# EasyEDA Pro project satelitesbol.eprj, board PCB7
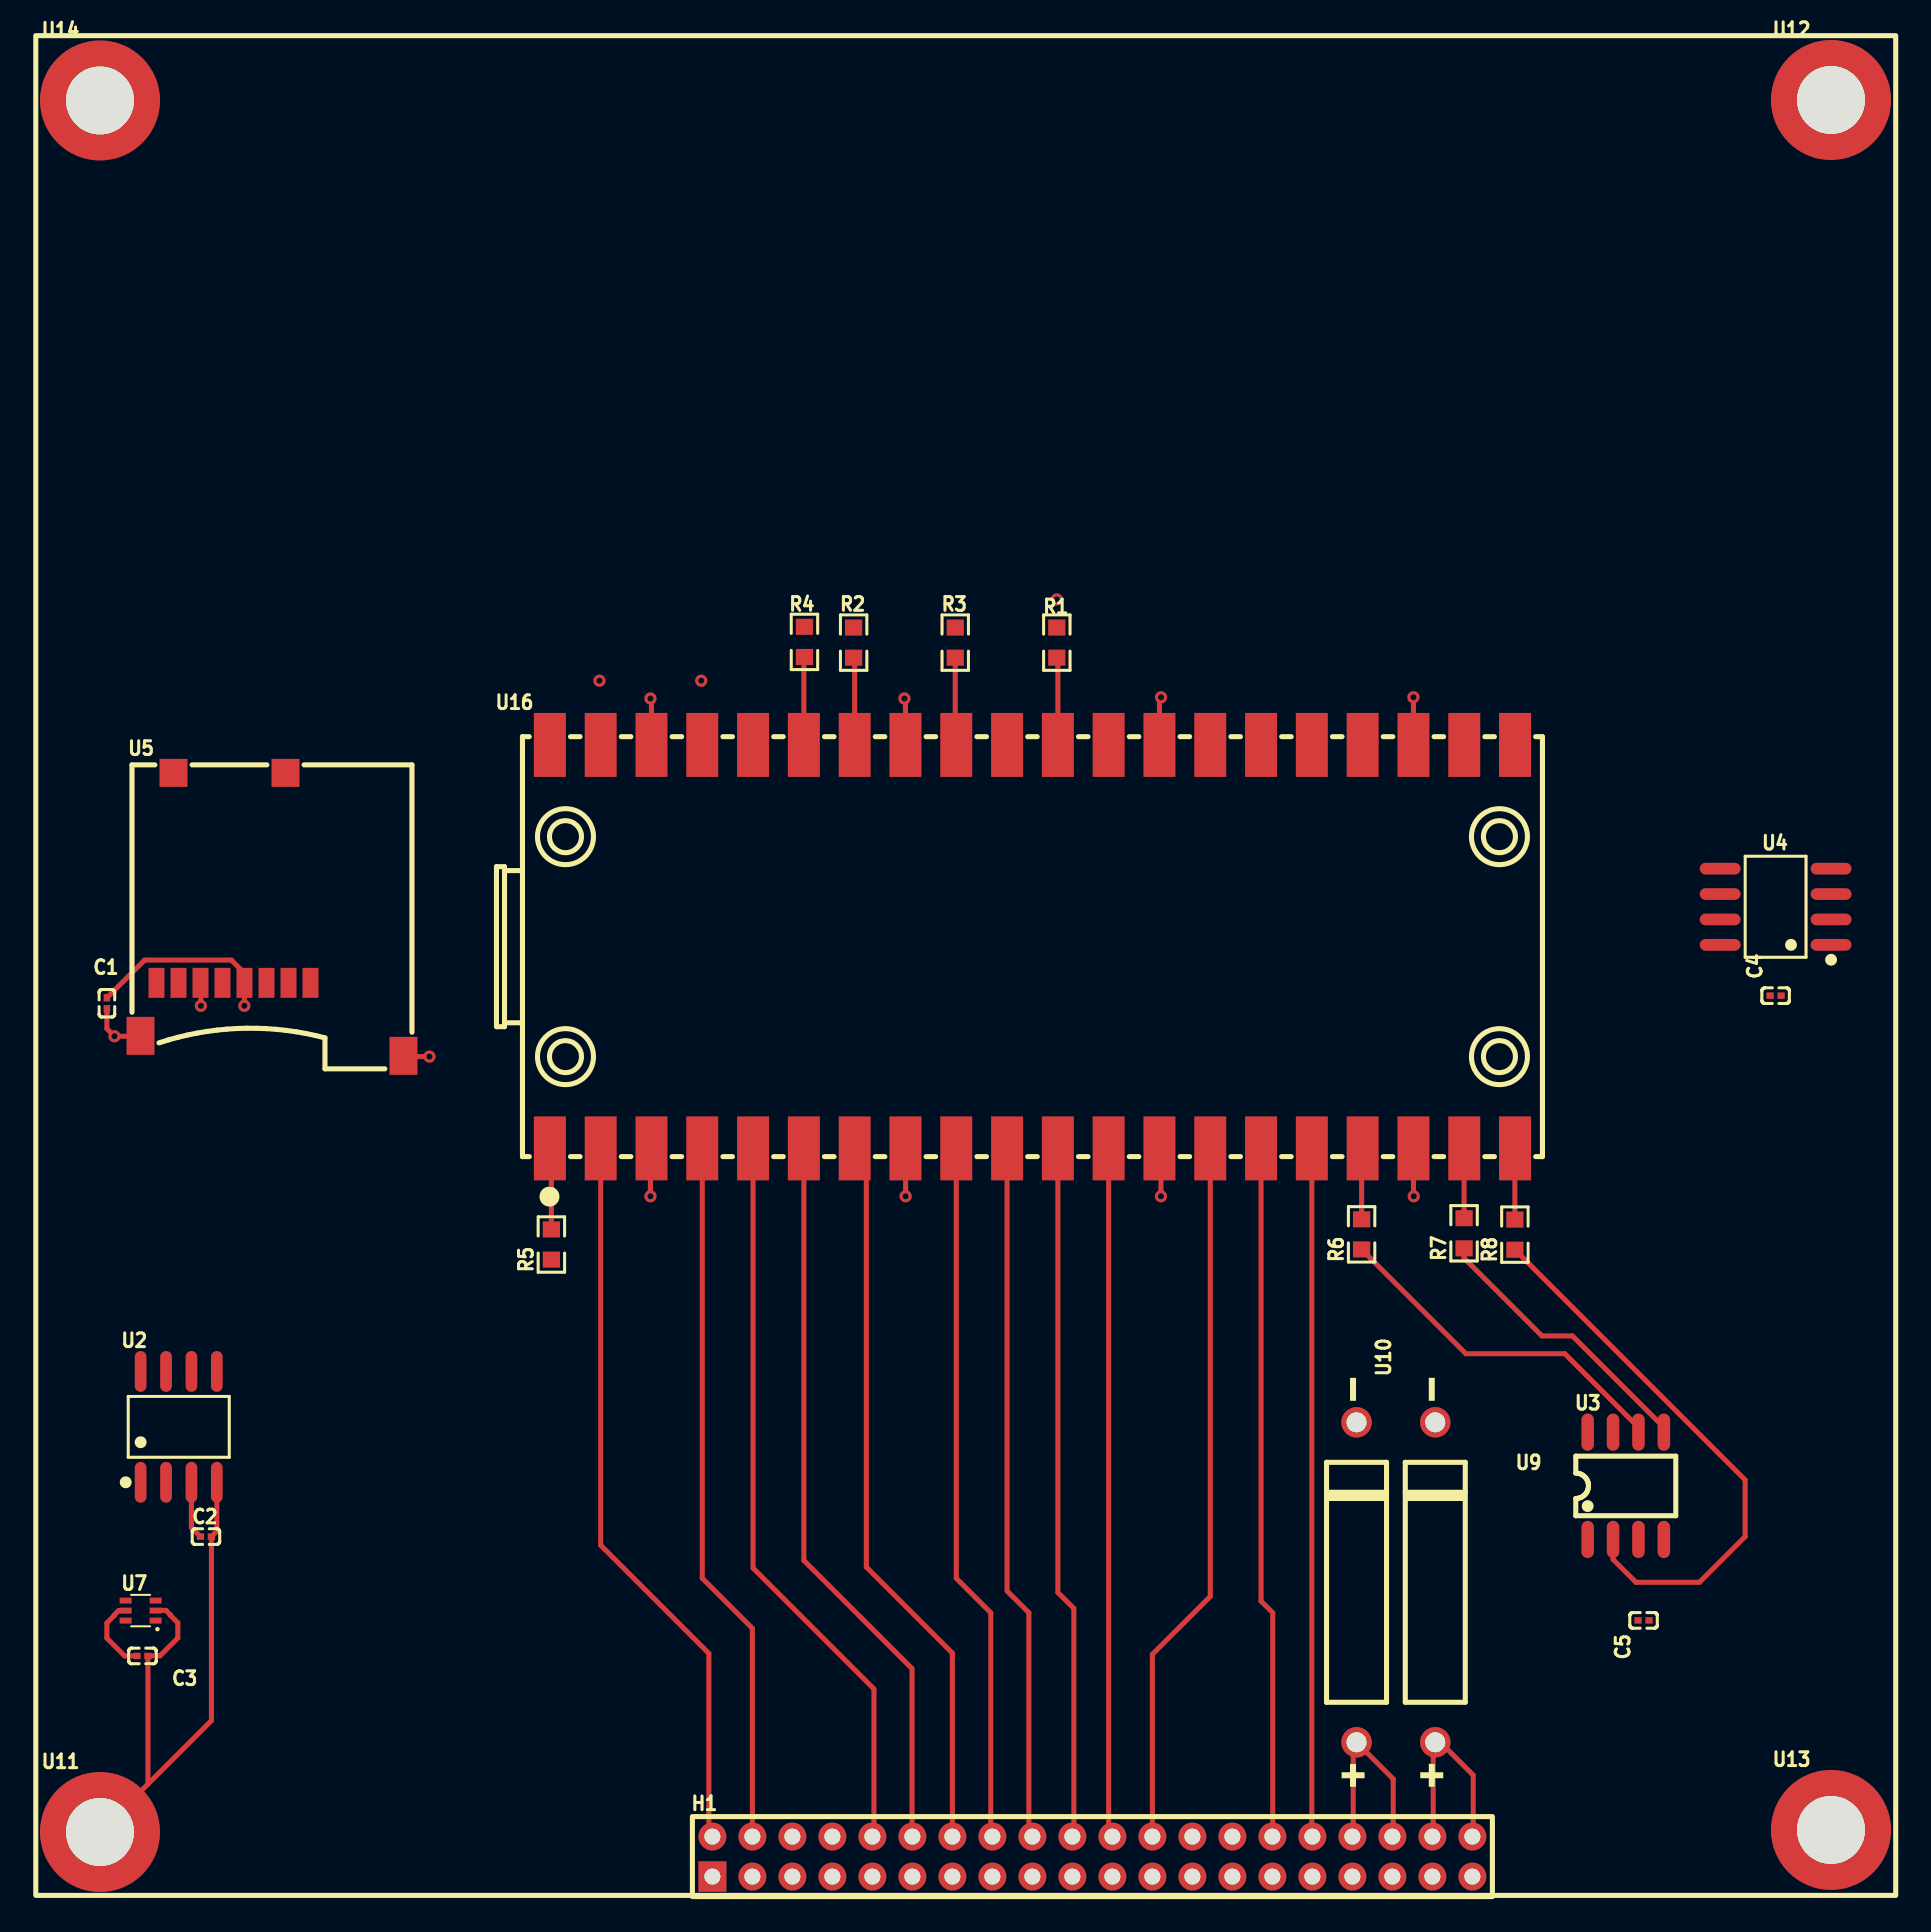
[diagram p8: board, top side]
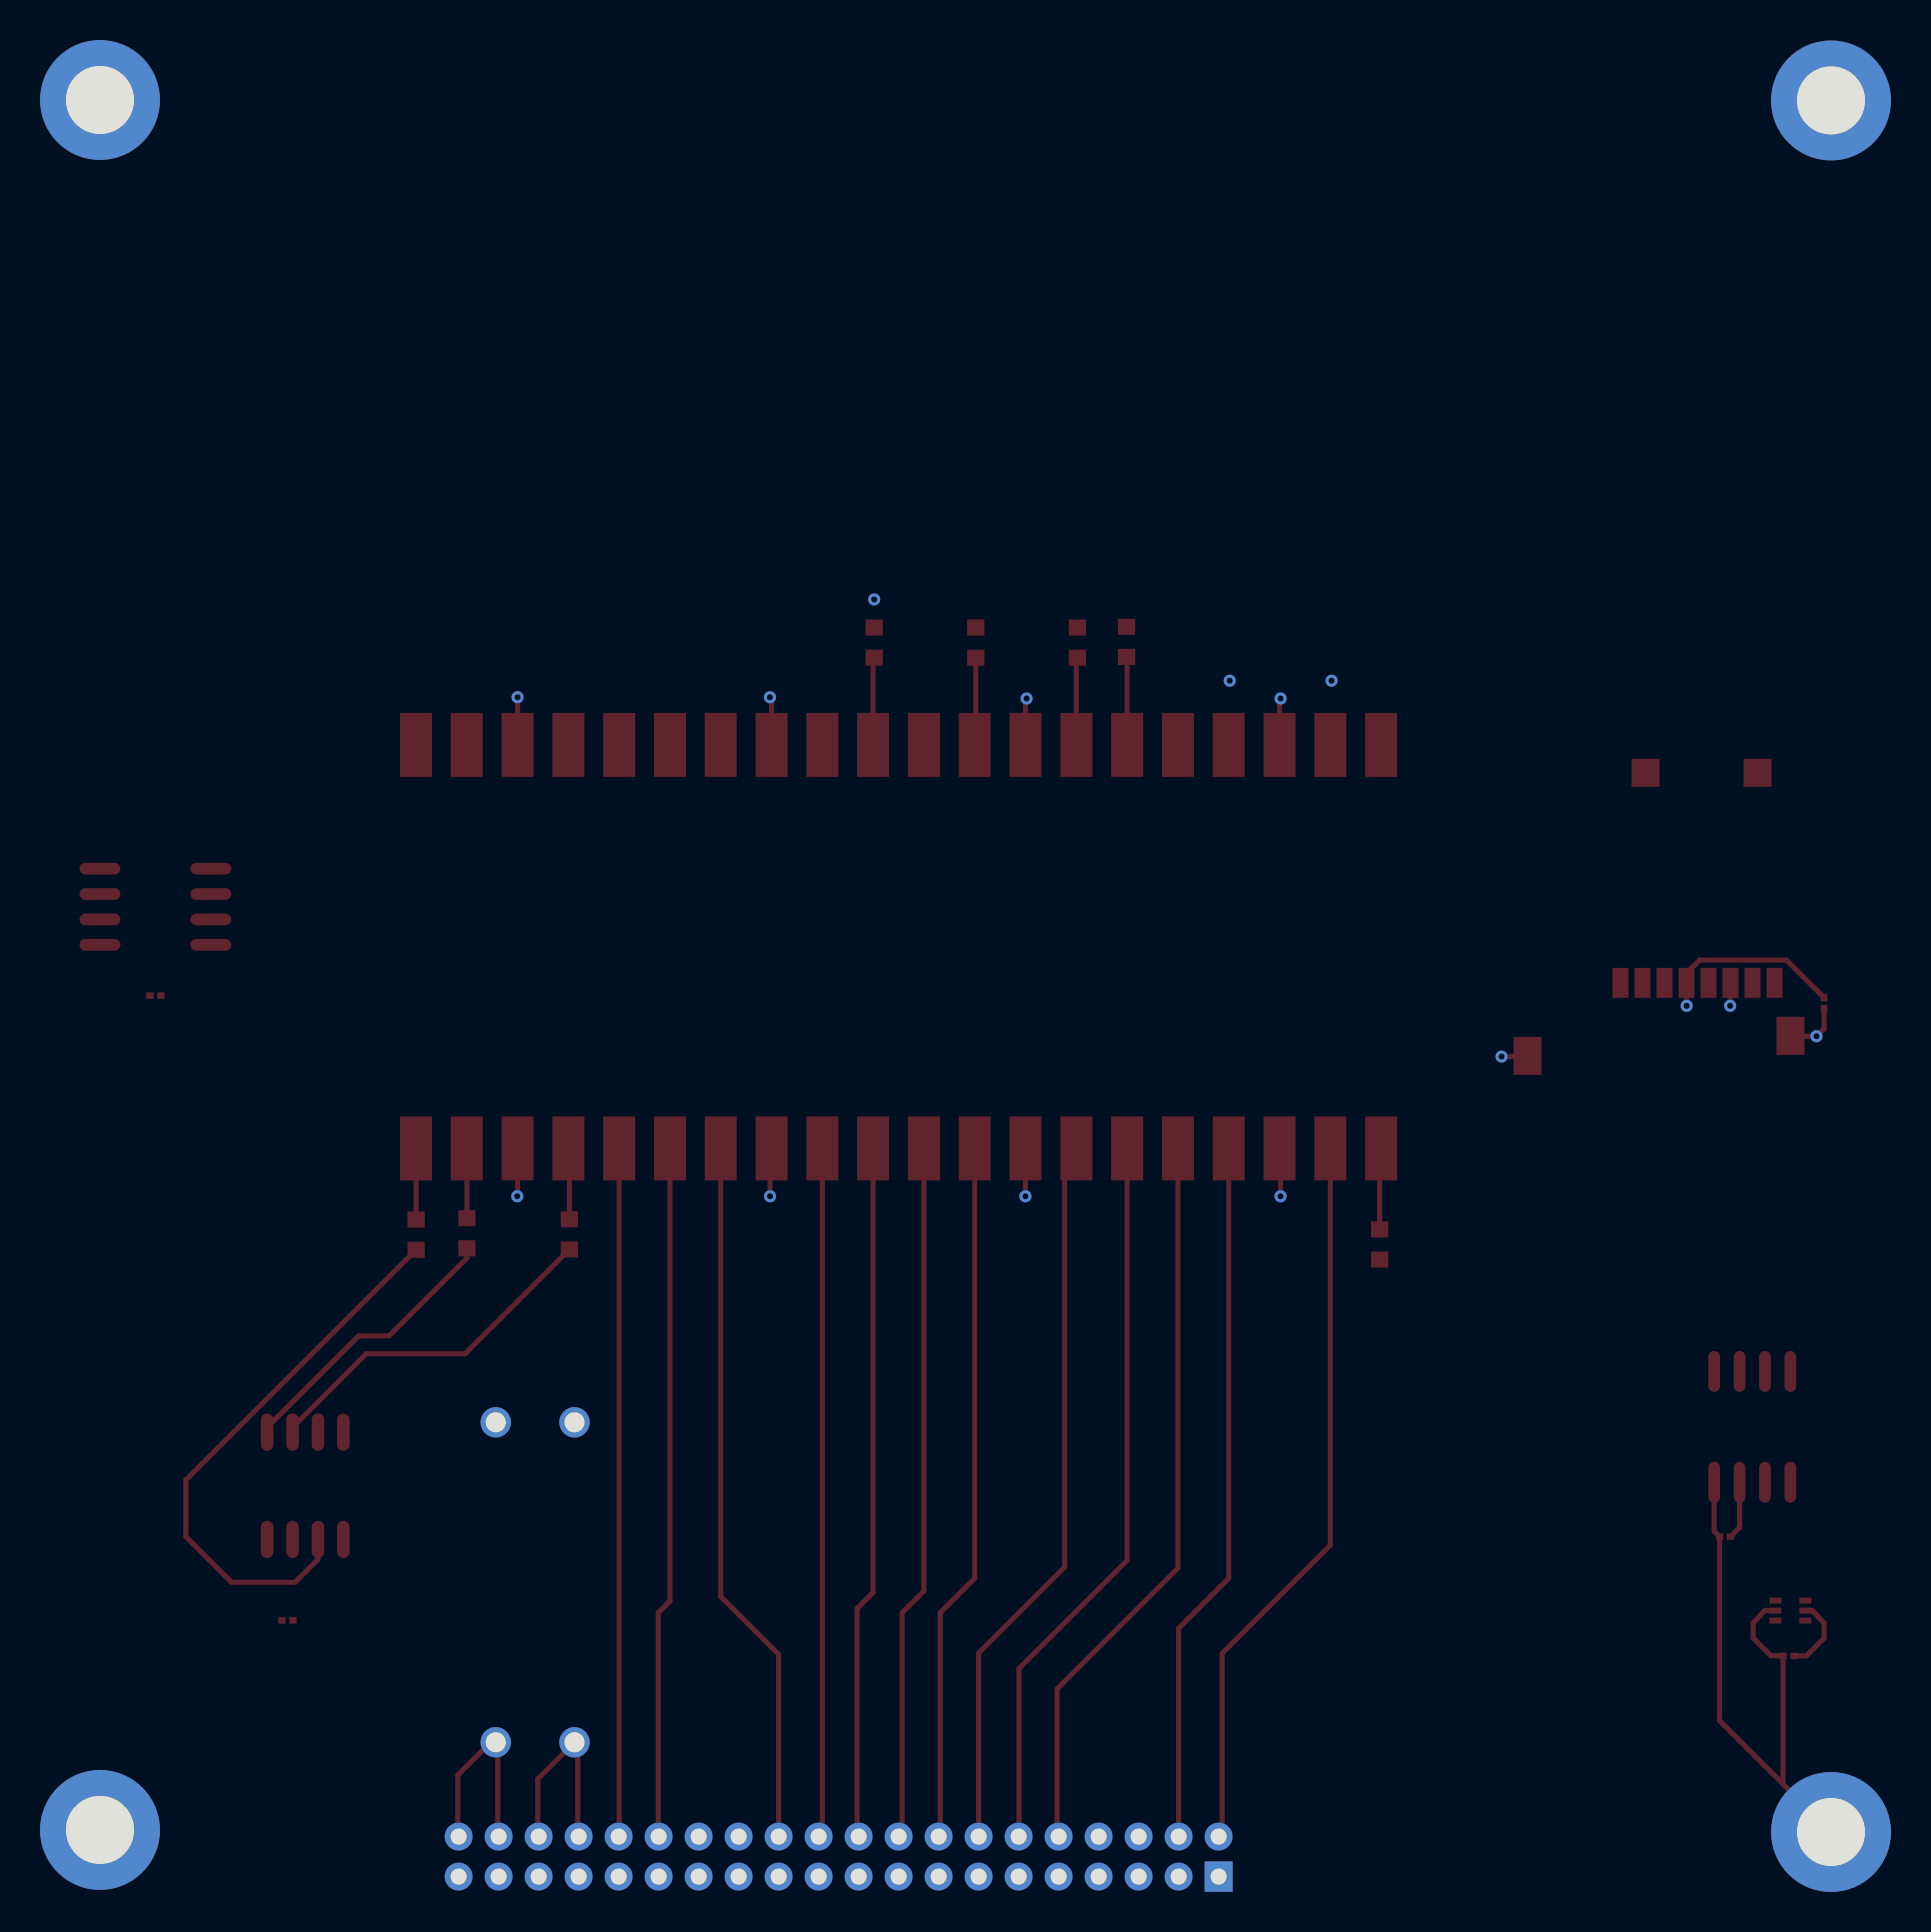
[diagram p9: board, bottom side, seen from below]

No outline. copper layers: Top Layer, Inner1, Inner2, Bottom Layer. Coordinates in mm from the lowest, leftmost part position.
Stack: Top Layer 0.035mm Outer layer thickness 1oz / Dielectric1 0.2104mm 7628 RC49% 8.6mil / Inner1 0.0152mm Inner layer thickness / Dielectric2 1.065mm 1.1mm H/HOZ Copper / Inner2 0.0152mm Inner layer thickness / Dielectric3 0.2104mm 7628 RC49% 8.6mil / Bottom Layer 0.035mm Outer layer thickness 1oz

## Design rules (mm)
template: JLCPCB Capability(Two Layers Board)
spacing copperThickness1oz (default): track to track 0.102, other pairs 0.152 to 0.3
spacing copperThickness2oz: track to track 0.203, other pairs 0.152 to 0.3
track width copperThickness1oz (default): min 0.127, default 0.254, max 2.54
track width copperThickness2oz: min 0.203, default 0.254, max 2.54
differential pair differentialPair (default): width min 0.127, default 0.254, max 2.54; gap min 0.152, default 0.152
via viaSize (default): diameter min 0.5, default 0.61, max 10; hole min 0.3, default 0.305, max 6.3

## Placement (name value [footprint] x y rotation side)
C1  10 µF  [C0201]  0.34 42.67 270 top
C2  10 µF  [C0201]  5.3 16 0 top
C3  10 µF  [C0201]  2.12 10.03 0 top
C4  10 µF  [C0201]  83.78 43.05 180 top
C5  10 µF  [C0201]  77.18 11.81 180 top
H1  TW-20-03-G-D-315-120  [HDR-TH_40P-P2.00-V-M-R2-C20-S2.00-1]  49.62 0 0 top
R1  10 kΩ  [R0603]  47.84 60.71 90 top
R2  10K  [R0603]  37.68 60.71 90 top
R3  10K  [R0603]  42.76 60.71 90 top
R4  10K  [R0603]  35.22 60.74 90 top
R5  10K  [R0603]  22.57 30.61 90 top
R6  10 kΩ  [R0603]  63.08 31.12 90 top
R7  10 kΩ  [R0603]  68.21 31.17 90 top
R8  10 kΩ  [R0603]  70.75 31.1 90 top
U2  MB85RS64PNF-G-JNERE1  [SOIC-8_L4.9-W3.9-P1.27-LS6.0-BL]  3.94 21.49 0 top
U3  PM004MNIATR  [SOP-8_L4.9-W3.9-P1.27-LS6.0-BL]  76.29 18.54 0 top
U4  24LC16BT-I/SN  [SOIC-8_L4.9-W3.9-P1.27-LS6.0-BL]  83.78 47.5 90 top
U5  M6027-01  [TF-SMD_M6027-01]  8.6 47.12 0 top
U7  TMP102AIDRLRG4  [SOT-563_L1.6-W1.2-P0.50-LS1.6-BR]  2.03 12.3 0 top
U9  2CL77  [DIO-TH_BD3.0-L12.0-P16.00-D0.6]  66.77 13.72 270 top
U10  2CL77  [DIO-TH_BD3.0-L12.0-P16.00-D0.6]  62.83 13.72 270 top
U11  -  [M_H]  0 1.23 0 top
U12  -  [M_H]  86.55 87.84 0 top
U13  -  [M_H]  86.55 1.33 0 top
U14  -  [M_H]  0 87.82 0 top
U16  ESP32-S3-Pico  [LCC-40_L51.0-W21.0-P2.54-BL_RP2040-BASED]  46.62 45.5 0 top

## Footprints (pads in the part's own frame, mm; a bottom-side part is the same pattern mirrored in y, then rotated)
C0201
  rect 0.368x0.324 smd: 1(-0.275,0) 2(0.275,0)
DIO-TH_BD3.0-L12.0-P16.00-D0.6
  round 1.524 hole 1: 1(-8,0) 2(8,0)
HDR-TH_40P-P2.00-V-M-R2-C20-S2.00-1
  rect 1.4x1.524 hole 0.8: 1(-19,-1)
  round 1.4 hole 0.8: 2(-19,1) 3(-17,-1) 4(-17,1) 5(-15,-1) 6(-15,1) 7(-13,-1) 8(-13,1) 9(-11,-1) 10(-11,1) 11(-9,-1) 12(-9,1) 13(-7,-1) 14(-7,1) 15(-5,-1) 16(-5,1) 17(-3,-1) 18(-3,1) 19(-1,-1) 20(-1,1) 21(1,-1) 22(1,1) 23(3,-1) 24(3,1) 25(5,-1) 26(5,1) 27(7,-1) 28(7,1) 29(9,-1) 30(9,1) 31(11,-1) 32(11,1) 33(13,-1) 34(13,1) 35(15,-1) 36(15,1) 37(17,-1) 38(17,1) 39(19,-1) 40(19,1)
LCC-40_L51.0-W21.0-P2.54-BL_RP2040-BASED
  rect 1.6x3.2 smd: 1(-24.13,-10.088) 2(-21.59,-10.088) 3(-19.05,-10.088) 4(-16.51,-10.088) 5(-13.97,-10.088) 6(-11.43,-10.088) 7(-8.89,-10.088) 8(-6.35,-10.088) 9(-3.81,-10.088) 10(-1.27,-10.088) 11(1.27,-10.088) 12(3.81,-10.088) 13(6.35,-10.088) 14(8.89,-10.088) 15(11.43,-10.088) 16(13.97,-10.088) 17(16.51,-10.088) 18(19.05,-10.088) 19(21.59,-10.088) 20(24.13,-10.088) 21(24.13,10.088) 22(21.59,10.088) 23(19.05,10.088) 24(16.51,10.088) 25(13.97,10.088) 26(11.43,10.088) 27(8.89,10.088) 28(6.35,10.088) 29(3.81,10.088) 30(1.27,10.088) 31(-1.27,10.088) 32(-3.81,10.088) 33(-6.35,10.088) 34(-8.89,10.088) 35(-11.43,10.088) 36(-13.97,10.088) 37(-16.51,10.088) 38(-19.05,10.088) 39(-21.59,10.088) 40(-24.13,10.088)
M_H
  round 6 hole 3.4: 1(0,0)
R0603
  rect 0.806x0.864 smd: 1(-0.753,0) 2(0.753,0)
SOIC-8_L4.9-W3.9-P1.27-LS6.0-BL
  oval 0.588x2.045 smd: 1(-1.905,-2.772) 2(-0.635,-2.772) 3(0.635,-2.772) 4(1.905,-2.772) 5(1.905,2.772) 6(0.635,2.772) 7(-0.635,2.772) 8(-1.905,2.772)
SOP-8_L4.9-W3.9-P1.27-LS6.0-BL
  oval 0.63x1.865 smd: 1(-1.905,-2.683) 2(-0.635,-2.683) 3(0.635,-2.683) 4(1.905,-2.683) 5(1.905,2.683) 6(0.635,2.683) 7(-0.635,2.683) 8(-1.905,2.683)
SOT-563_L1.6-W1.2-P0.50-LS1.6-BR
  rect 0.6x0.3 smd: 1(0.75,-0.5) 2(0.75,0) 3(0.75,0.5) 4(-0.75,0.5) 5(-0.75,0) 6(-0.75,-0.5)
TF-SMD_M6027-01
  rect 0.8x1.5 smd: 1(1.925,-3.425) 2(0.825,-3.425) 3(-0.275,-3.425) 4(-1.375,-3.425) 5(-2.475,-3.425) 6(-3.575,-3.425) 7(-4.675,-3.425) 8(-5.775,-3.425)
  rect 1.4x1.4 smd: 9(-4.925,7.075) 10(0.675,7.075)
  rect 1.4x1.9 smd: 11(6.575,-7.075) 12(-6.575,-6.075)

## Nets
As in the schematic, except:
COMMON_SCL: H1.8 H1.26 R5.1
COMMON_SDA: H1.6 H1.28 R4.2 U4.5

Pads without a net: H1 5 7 9 11 13 15 17 19 21 23 25 27 29 31 33 35 37; U3 3 7; U4 1 2 3 6 7; U5 1 2 3 5 7 8 9 10; U7 1 3 4 6; U16 21 22 26 27 29 31 36 40

## Via types
v1: diameter 0.61, hole 0.305, Top Layer to Bottom Layer, 15 vias

## Routing (per net, layer and track width the routed paths; a pad name or vN(x,y) marks a point on that pad's centre or on a via; arc(x,y) is an arc through that point)
GND: length 413.2
  Top Layer w0.254: U16.23 v1(65.67,57.97) ; 2.39,10.04 3,10.04 3.89,10.93 3.89,11.69 3.53,12.05 3.53,12.08 3.3,12.31 2.95,12.31 ; v1(40.28,33.02) 40.28,35.41 U16.8 ; v1(16.47,40) 15.21,40 U5.11 ; U16.18 65.67,33.04 v1(65.69,33.02) ; 2.4,3.63 5.57,6.8 C2.2 5.84,16.27 U2.4 ; 2.4,3.63 C3.2 ; 2.4,3.63 U11.1 ; U16.33 40.27,57.86 v1(40.22,57.91) ; U5.6 5.04,43.67 v1(5.04,42.54) ; v1(27.52,33.02) 27.52,35.36 U16.3 ; v1(27.52,57.91) 27.57,57.86 U16.38 ; v1(53.05,33.02) 53.05,35.34 U16.13 ; U5.12 2,41.02 v1(0.73,41.02) 0.34,41.4 C1.2 ; v1(53.05,57.97) 52.97,57.89 U16.28
  Inner1 w0.254: v1(5.04,42.54) 5.04,42.46 3.6,41.02 ; 46.99,57.91 52.99,57.91 v1(53.05,57.97) ; 46.99,57.91 v1(40.22,57.91) v1(27.52,57.91) ; 46.99,57.91 46.99,33.02 ; U11.1 -2.2,3.42 -2.2,38.1 ; v1(65.67,57.97) 88.61,80.91 ; 88.61,80.91 88.61,85.79 U12.1 ; 88.61,80.91 88.61,37.1 ; 3.6,41.02 15.46,41.02 v1(16.47,40) 20.54,40 v1(27.52,33.02) v1(40.28,33.02) 46.99,33.02 ; 3.6,41.02 v1(0.73,41.02) -2.2,38.1 ; U13.1 88.61,3.39 88.61,37.1 ; -2.2,38.1 -2.2,85.62 U14.1 ; 46.99,33.02 v1(53.05,33.02) v1(65.69,33.02) 84.53,33.02 88.61,37.1
(no net): length 24.6
  Inner1 w0.254: v1(47.84,62.87) 34.13,62.87 v1(30.06,58.8) v1(24.97,58.8)
3.3_VIN: length 16.3
  Top Layer w0.254: C3.1 1.23,10.03 0.34,10.92 0.34,11.68 0.7,12.04 0.7,12.07 0.94,12.3 U7.5 ; C1.1 2.23,44.83 6.57,44.83 7.22,44.17 U5.4 7.22,43.68 v1(7.22,42.54) ; C2.1 4.57,16.45 U2.3
PAYLOAD_SCL: length 4.4
  Top Layer w0.254: U16.34 37.73,59.9 R2.1
PAYLOAD_SDA: length 4.4
  Top Layer w0.254: R3.1 42.76,55.64 U16.32
$1N3249: length 10.5
  Top Layer w0.254: 64.66,0.87 64.66,3.88 U10.2 62.66,5.55 62.66,0.87
$1N4741: length 10.5
  Top Layer w0.254: 66.66,0.87 66.66,5.36 67.02,5.72 68.66,4.07 68.66,0.87
$1N5404: length 4.5
  Top Layer w0.254: U16.30 47.89,59.97 47.8,60.07
$1N6032: length 4.4
  Top Layer w0.254: R4.1 35.19,59.96 U16.35
$1N6082: length 4.1
  Top Layer w0.254: R5.2 22.57,35.34 U16.1
$1N6117: length 36.7
  Top Layer w0.254: H1.2 30.44,1.18 30.44,10.16 25.03,15.57 U16.2
$1N6123: length 35.5
  Top Layer w0.254: H1.4 32.62,11.41 30.11,13.92 U16.4
$1N6159: length 37
  Top Layer w0.254: U16.5 32.66,14.43 38.7,8.38 38.7,1.08 H1.10
$1N6169: length 36.7
  Top Layer w0.254: H1.12 40.6,1.02 40.6,9.4 35.19,14.81 U16.6
$1N6181: length 36.4
  Top Layer w0.254: U16.7 38.32,34.83 38.32,14.48 42.62,10.18 H1.14
$1N6188: length 35.2
  Top Layer w0.254: H1.16 44.54,1.08 44.54,12.19 42.81,13.92 U16.9
$1N6199: length 34.9
  Top Layer w0.254: H1.18 46.45,1.18 46.45,12.19 45.35,13.28 U16.10
$1N6206: length 34.8
  Top Layer w0.254: H1.20 48.69,1.07 48.69,12.41 47.89,13.21 U16.11
$1N6217: length 34.5
  Top Layer w0.254: H1.22 50.43,1.19 U16.12
$1N6224: length 35.6
  Top Layer w0.254: U16.14 55.51,13.01 52.62,10.11 H1.24
$1N6261: length 34.7
  Top Layer w0.254: U16.15 58.05,12.78 58.64,12.19 58.64,1.02 H1.30
$1N6270: length 34.4
  Top Layer w0.254: U16.16 60.59,1.03 H1.32
$1N6332: length 3.6
  Top Layer w0.254: R6.2 63.08,35.36 U16.17
$1N6341: length 17.8
  Top Layer w0.254: R6.1 68.3,25.15 73.24,25.15 76.93,21.46 U3.6
$1N6394: length 3.5
  Top Layer w0.254: U16.19 68.21,35.41 R7.2
$1N6401: length 14.2
  Top Layer w0.254: R7.1 68.21,29.93 72.1,26.03 73.62,26.03 78.2,21.46 U3.5
$1N6592: length 28.1
  Top Layer w0.254: R8.1 82.26,18.83 82.26,16 79.97,13.72 76.8,13.72 75.66,14.86 U3.2
$1N6595: length 3.6
  Top Layer w0.254: R8.2 70.75,35.41 U16.20
